# Altium project TSE_battery_commutation.PrjPcb
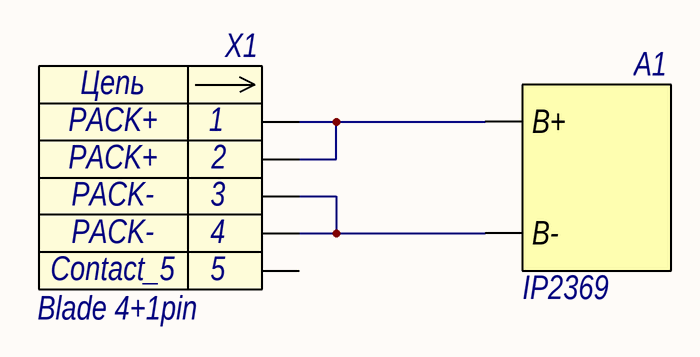
[diagram p0: TSE_battery_commutation_board.SchDoc]
1 sheet, 2 parts. Net scope: global (net labels, ports and power ports of the same name join across sheets).
Board file: TSE_battery_commutation_board.PcbDoc

## Sheet TSE_battery_commutation_board.SchDoc
size 420 x 297 mm; SheetNumber: 1; SheetTotal: 1

### Parts
A1  IP2369  [IP2369]
X1  Blade 4+1pin  [Blade 4+1P F]

### Nets
NetA1_1: A1.1(B+) X1.1 X1.2
NetA1_2: A1.2(B-) X1.3 X1.4

### Notes on the sheet
- Перв. примен.
- Справ. №
- Подп. и дата
- Инв. № дубл.
- Взам. инв. №
- Изм.
- Лист
- № докум.
- Подп.
- Дата
- Лит.
- Масса
- Масштаб
- Т.контр.
- Пров.
- Разраб.
- Листов
- Инв. № подл.
- Н.контр.
- Файл:
- Утв.
- Копировал
- Формат

### Library data of the parts
A1 = IP2369: Power delivery модуль IP2369; Наименование: IP2369
X1 = Blade 4+1P F: Ножевой разъём - 4 конт. угловая вилка на плату с шагом 2.54мм; Contact_1: PACK+; Contact_3: PACK-; Contact_2: PACK+; Contact_4: PACK-; Наименование: Blade 4+1pin; Contact_5: Contact_5